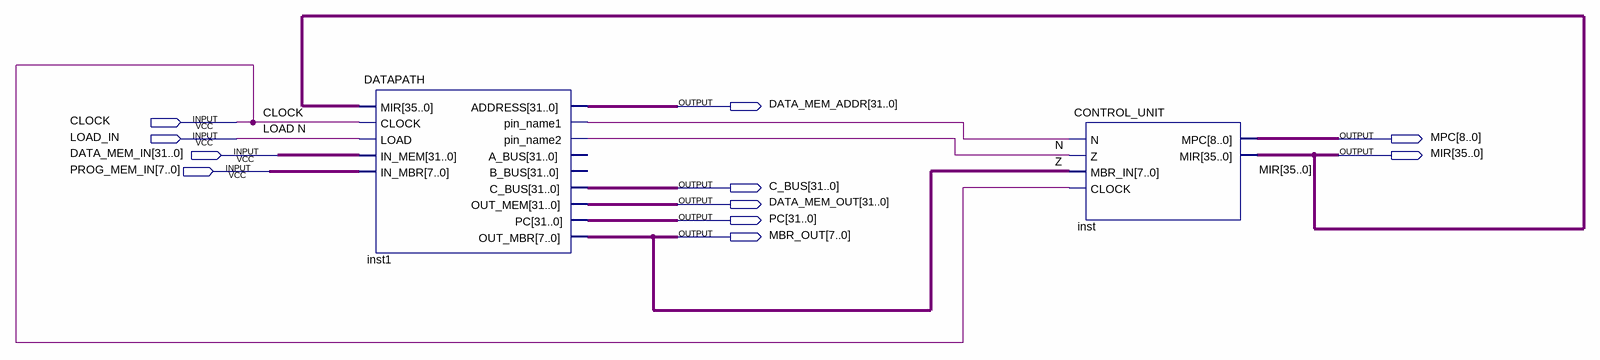
[diagram p0: schematic sheet]
// Quartus schematic CPU.bdf as structural Verilog: 2 symbols, 11 pins
module CPU (
  input  CLOCK,
  input  LOAD_IN,
  input  [31:0] DATA_MEM_IN,
  input  [7:0] PROG_MEM_IN,
  output [31:0] DATA_MEM_ADDR,
  output [8:0] MPC,
  output [35:0] MIR,
  output [31:0] C_BUS,
  output [31:0] DATA_MEM_OUT,
  output [31:0] PC,
  output [7:0] MBR_OUT
);

  wire N, Z;

  DATAPATH inst1 (
    .MIR(MIR), .CLOCK(CLOCK), .LOAD(LOAD_IN), .IN_MEM(DATA_MEM_IN), .IN_MBR(PROG_MEM_IN),
    .ADDRESS(DATA_MEM_ADDR), .pin_name1(N), .pin_name2(Z), .C_BUS(C_BUS), .OUT_MEM(DATA_MEM_OUT), .PC(PC),
    .OUT_MBR(MBR_OUT));  // open: A_BUS, B_BUS
  CONTROL_UNIT inst (.N(N), .Z(Z), .MBR_IN(MBR_OUT), .CLOCK(CLOCK), .MPC(MPC), .MIR(MIR));

  // Other names for the same wires on the sheet: LOAD N = LOAD_IN
endmodule
